# EasyEDA Pro project EVA_RT.eprj, schematic EVA_RT
Board Name: #3_EVA_RT; Create Date: 2025-01-23; Page Name: P1; Project Name: EVA_RT; Schematic Name: EVA_RT; Update Date: 2025-01-28; Company: EasyEDA.com; Drawed: EasyEDA Pro; Page Size: A4; Part Number: JLCPCB-002; Reviewed: EasyEDA Pro; Version: V0.1
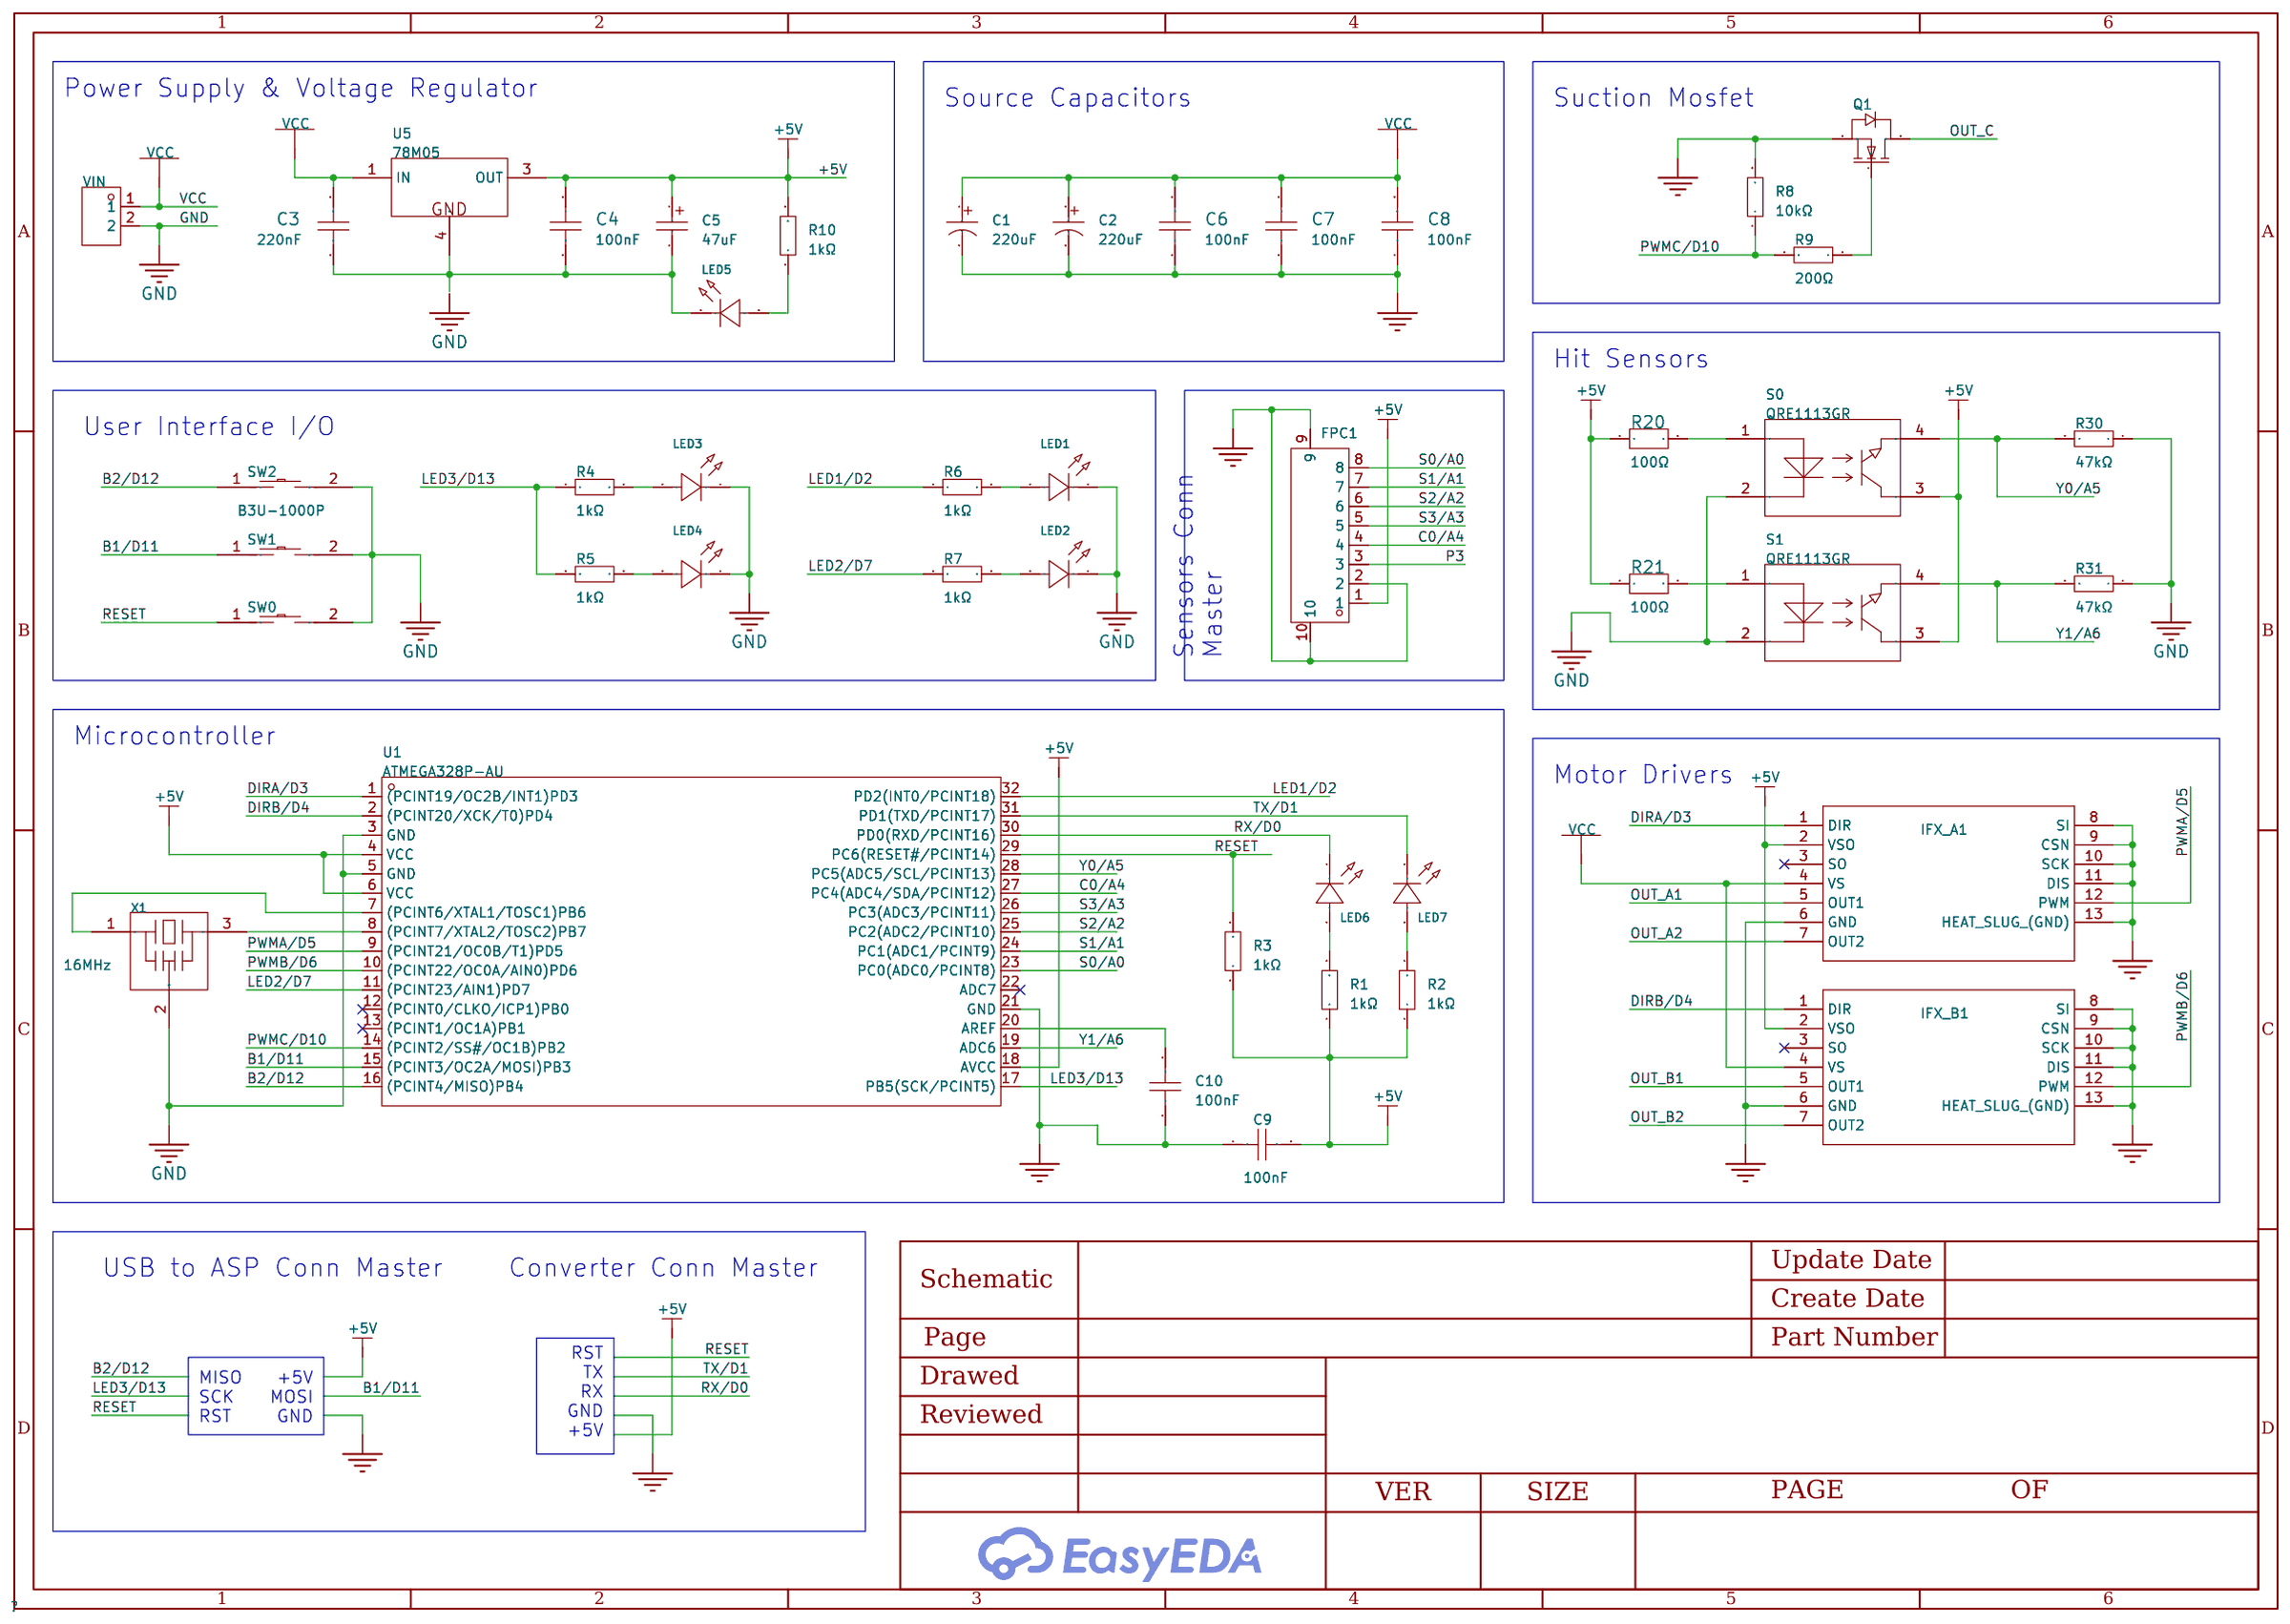
[diagram p2: schematic sheet]

## Parts
C1  220uF  [CAP-TH_BD6.3-P2.50-D1.0-FD]
C2  220uF  [CAP-TH_BD6.3-P2.50-D1.0-FD]
C3  220nF  [C0805]
C4  100nF  [C0805]
C5  47uF  [CAP-SMD_L3.2-W1.6-RD]
C6  100nF  [C0805]
C7  100nF  [C0805]
C8  100nF  [C0805]
C9  100nF  [C0603]
C10  100nF  [C0603]
FPC1  FFC05001-08SBA124W5M  [FFC-SMD_FFC05001-08SBA124W5M]
IFX_A1  -  [PG-DSO-12-17]
IFX_B1  -  [PG-DSO-12-17]
LED1  XL-1608SURC-06  [LED0603-RD_RED]
LED2  XL-1608SURC-06  [LED0603-RD_RED]
LED3  XL-1608SURC-06  [LED0603-RD_RED]
LED4  XL-1608SURC-06  [LED0603-RD_RED]
LED5  XL-1608SURC-06  [LED0603-RD_RED]
LED6  XL-1608SURC-06  [LED0603-RD_RED]
LED7  XL-1608SURC-06  [LED0603-RD_RED]
Q1  IRFR3411TR-VB  [TO-252-2_L6.6-W6.1-P4.57-LS9.9-BR-CW]
R1  1kΩ  [R0603]
R2  1kΩ  [R0603]
R3  1kΩ  [R0603]
R4  1kΩ  [R0603]
R5  1kΩ  [R0603]
R6  1kΩ  [R0603]
R7  1kΩ  [R0603]
R8  10kΩ  [R0603]
R9  200Ω  [R0603]
R10  1kΩ  [R0603]
R20  100Ω  [R0603]
R21  100Ω  [R0603]
R30  47kΩ  [R0603]
R31  47kΩ  [R0603]
S0  QRE1113GR  [OPTO-SMD_QRE1113GR]
S1  QRE1113GR  [OPTO-SMD_QRE1113GR]
SW0  B3U-1000P  [KEY-SMD_B3U-1000PM]
SW1  B3U-1000P  [KEY-SMD_B3U-1000PM]
SW2  B3U-1000P  [KEY-SMD_B3U-1000PM]
U1  ATMEGA328P-AU  [TQFP-32_L7.0-W7.0-P0.80-LS9.0-BL]
U5  78M05  [TO-252-2_L6.5-W6.1-P4.58-LS10.0-TL]
VIN  KH-2.54PH180-1X2P-L11.5  [HDR-TH_2P-P2.54-V-M]
X1  16MHz  [OSC-SMD_3P-L3.2-W1.3-P1.2-L]

## Library data of the parts
C1 C2 = KM221M025E110A: Capacitance: Tolerance:±20% Tolerance:±20% Rated Voltage: φD: L: Lead Spacing: Lifetime @ Temp:2000hrs@105℃; LCSC Part Name: 220uF ±20% 25V; Supplier Part: C59416; Manufacturer: CapXon(丰宾); Supplier Footprint: 插件,D6.3xL11mm; JLCPCB Part Class: Extended Part; Datasheet: https://atta.szlcsc.com/upload/public/pdf/source/20150922/1457707409206.pdf; Supplier: LCSC; Tolerance: ±20%; Lifetime @ Temp: 2000hrs@105℃
C3 C4 C6-C8 = 0805B104M250CT: Capacitance: Tolerance:±20% Tolerance:±20% Voltage Rated: Temperature Coefficient:; LCSC Part Name: 100nF ±20% 25V; Supplier Part: C163183; Manufacturer: Walsin(华新科); Supplier Footprint: 0805; JLCPCB Part Class: Extended Part; Datasheet: https://atta.szlcsc.com/upload/public/pdf/source/20190614/C388069_4B3EF5497F6DC8E8932D1232046A3033.pdf; Supplier: LCSC; Tolerance: ±20%
C5 = TC212A476K006Y: Capacitance: Tolerance:±10% Tolerance:±10% Rated Voltage: Equivalent Series Resistance(ESR):2.5Ω@100kHz Operating Temperature:-55℃~+125℃ Operating Temperature:-55℃~+125℃; LCSC Part Name: 47uF ±10% 6.3V; Supplier Part: C108525; Manufacturer: Sunlord(顺络); Supplier Footprint: CASE-A-3216; JLCPCB Part Class: Extended Part; Datasheet: https://atta.szlcsc.com/upload/public/pdf/source/20231030/DDA5D10C6B7FCAF98AC7C23C2BD0B0CB.pdf; Supplier: LCSC; Tolerance: ±10%; Equivalent Series Resistance(ESR): 2.5Ω@100kHz; Operating Temperature: -55℃~+125℃
C9 C10 = C1608NP01H101JT000N: Capacitance: Tolerance:±5% Tolerance:±5% Voltage Rated: Temperature Coefficient:; LCSC Part Name: 100pF ±5% 50V; Supplier Part: C343033; Manufacturer: TDK; Supplier Footprint: 0603; JLCPCB Part Class: Extended Part; Datasheet: https://atta.szlcsc.com/upload/public/pdf/source/20190311/C343033_2C1C068BC0A68B1F01ED28762004C2DC.pdf; Supplier: LCSC; Tolerance: ±5%
FPC1 = FFC05001-08SBA124W5M: Locking Feature:抽屉式 Contact Type:Contact,Top Number of Contacts:8P Pitch:0.5mm Mounting Type:卧贴 FFC, FCB Thickness:0.3mm FFC, FCB Thickness:0.3mm Height Above Board:2mm; LCSC Part Name: 间距:0.5mm P数:8P 抽屉式 上接; Supplier Part: C456419; Manufacturer: TXGA(特思嘉); Supplier Footprint: SMD,P=0.5mm,卧贴; JLCPCB Part Class: Extended Part; Datasheet: https://atta.szlcsc.com/upload/public/pdf/source/20191118/C456760_2EA6D213D04401C3F6010DA75CB9EC31.pdf; Supplier: LCSC; Locking Feature: 抽屉式; Contact Type: Contact,Top; Number of Contacts: 8P; Pitch: 0.5mm; Mounting Type: 卧贴; FFC, FCB Thickness: 0.3mm; Height Above Board: 2mm
IFX_A1 IFX_B1 = IFX9201SGAUMA1_
LED1-LED7 = XL-1608SURC-06: Emitted Color:Red Power Dissipation:55mW Forward Current:25mA Dominant Wavelength:617nm~621nm Dominant Wavelength:617nm~621nm Peak Wavelength:623nm Lens Color:无色透明透镜 Color Temperature:- Color Temperature:- Viewing Angle:120° Mounting Sytle:Positive post O; Supplier Part: C965799; Manufacturer: XINGLIGHT(成兴光); Supplier Footprint: 0603; JLCPCB Part Class: Extended Part; Datasheet: https://atta.szlcsc.com/upload/public/pdf/source/20221102/D860AFDD1CDB02C5A8064103A32707E2.pdf; Supplier: LCSC; Emitted Color: Red; Power Dissipation: 55mW; Forward Current: 25mA; Dominant Wavelength: 617nm~621nm; Peak Wavelength: 623nm; Lens Color: 无色透明透镜; Viewing Angle: 120°; Mounting Sytle: Positive post; Operating Temperature: -30℃~+85℃
Q1 = IRFR3411TR-VB: Type:1个NChannel Drain Source Voltage (Vdss): Continuous Drain Current (Id): Power Dissipation (Pd):- Drain Source On Resistance (RDS(on)@Vgs,Id):30mΩ@10V,40A Gate Threshold Voltage (Vgs(th)@Id):- Total Gate Charge (Qg@Vgs):- Input Capacitance (Ciss@Vds):-; LCSC Part Name: 1个N沟道 耐压:100V 电流:40A; Supplier Part: C879037; Manufacturer: VBsemi(微碧半导体); Supplier Footprint: TO-252-2; JLCPCB Part Class: Extended Part; Datasheet: https://atta.szlcsc.com/upload/public/pdf/source/20230505/CCB1EF06EBEE64800B0B9BD62D42A77A.pdf; Supplier: LCSC; Type: 1个NChannel; Drain Source On Resistance (RDS(on)@Vgs,Id): 30mΩ@10V,40A
R1-R7 R9 R10 = RC0603FR-071KL: Type:Thick Film Resistors Resistance: Tolerance:±1% Tolerance:±1% Power(Watts): Overload Voltage (Max): Temperature Coefficient:±100ppm/℃ Temperature Coefficient:±100ppm/℃ Operating Temperature Range:-55℃~+155℃ Operating Temperature Range:-55℃~+155℃; LCSC Part Name: 厚膜电阻 1kΩ ±1% 100mW; Supplier Part: C22548; Manufacturer: YAGEO(国巨); Supplier Footprint: 0603; JLCPCB Part Class: Extended Part; Datasheet: https://atta.szlcsc.com/upload/public/pdf/source/20180316/70C0E2BDAE7FCC62C531A5A58D202EE1.pdf; Supplier: LCSC; Type: Thick Film Resistors; Tolerance: ±1%; Temperature Coefficient: ±100ppm/℃; Operating Temperature Range: -55℃~+155℃
R8 = RC0603FR-071KL: Type:Thick Film Resistors Resistance: Tolerance:±1% Tolerance:±1% Power(Watts): Overload Voltage (Max): Temperature Coefficient:±100ppm/℃ Temperature Coefficient:±100ppm/℃ Operating Temperature Range:-55℃~+155℃ Operating Temperature Range:-55℃~+155℃; LCSC Part Name: 厚膜电阻 1kΩ ±1% 100mW; Supplier Part: C22548; Manufacturer: YAGEO(国巨); Supplier Footprint: 0603; JLCPCB Part Class: Extended Part; Datasheet: https://atta.szlcsc.com/upload/public/pdf/source/20180316/70C0E2BDAE7FCC62C531A5A58D202EE1.pdf; Supplier: LCSC; Type: Thick Film Resistors; Tolerance: ±1%; Temperature Coefficient: ±100ppm/℃; Operating Temperature Range: -55℃~+155℃; Check: false
R20 R21 = SCR0603J100R: Resistance: Tolerance:±5% Tolerance:±5%; LCSC Part Name: 100Ω ±5%; Supplier Part: C3017758; Manufacturer: VO(翔胜); Supplier Footprint: 0603; JLCPCB Part Class: Extended Part; Datasheet: https://atta.szlcsc.com/upload/public/pdf/source/20220513/247AF9639BA21CF93567DC289CCC6A22.pdf; Supplier: LCSC; Tolerance: ±5%
R30 R31 = AC0603FR-0747KL: Type:Thick Film Resistors Resistance: Tolerance:±1% Tolerance:±1% Power(Watts): Temperature Coefficient:±100ppm/℃ Temperature Coefficient:±100ppm/℃ Overload Voltage (Max): Operating Temperature Range:-55℃~+155℃ Operating Temperature Range:-55℃~+155℃; LCSC Part Name: 47kΩ ±1% 100mW; Supplier Part: C111134; Manufacturer: YAGEO(国巨); Supplier Footprint: 0603; JLCPCB Part Class: Extended Part; Datasheet: https://atta.szlcsc.com/upload/public/pdf/source/20171221/C111134_15138309997331195189.pdf; Supplier: LCSC; Type: Thick Film Resistors; Tolerance: ±1%; Temperature Coefficient: ±100ppm/℃; Operating Temperature Range: -55℃~+155℃
S0 S1 = QRE1113GR: Supplier Part: C232862; Manufacturer: onsemi(安森美); Supplier Footprint: SMD-4P; JLCPCB Part Class: Extended Part; Datasheet: https://atta.szlcsc.com/upload/public/pdf/source/20221020/4EA8EB874547A092CF9AAECC2DF94CC1.pdf; Supplier: LCSC
SW0-SW2 = B3U-1000P_C231329: Circuit:SPST Actuator Style:Round Button Operating Force:153gf Mounting Style:Brick nogging Switch Length:3mm Switch Width:2.5mm Switch Height:1.6mm Contact Current:50mA Voltage Rating (DC):12V With Lamp:- Pin Style:SMDSplicing Mechanical Life:- Operating; LCSC Part Name: 3*2.5*1.6mm 立贴 轻触开关; Supplier Part: C231329; Manufacturer: OMRON(欧姆龙); Supplier Footprint: SMD,2.5x3mm; JLCPCB Part Class: Extended Part; Supplier: LCSC; Circuit: SPST; Actuator Style: Round Button; Operating Force: 153gf; Mounting Style: Brick nogging; Switch Length: 3mm; Switch Width: 2.5mm; Switch Height: 1.6mm; Contact Current: 50mA; Voltage Rating (DC): 12V; Pin Style: SMDSplicing; Operating Temperature: -25℃~+70℃
U1 = ATMEGA328P-AU_C14877: Application Area:- CPU Core:AVR CPU Maximum Speed:20MHz Operating Voltage Range:1.8V~5.5V Operating Voltage Range:1.8V~5.5V Program Storage Size:32KB Program Memory Type:FLASH RAM Size:2KB EEPROM:1KB GPIO Ports Number:23 ADC (Bit):10bit DAC (Bit):- PWM (B; Supplier Part: C14877; Manufacturer: MICROCHIP(美国微芯); Supplier Footprint: TQFP-32(7x7); JLCPCB Part Class: Basic Part; Datasheet: https://atta.szlcsc.com/upload/public/pdf/source/20140621/1457707095197.pdf; Supplier: LCSC; CPU Core: AVR; CPU Maximum Speed: 20MHz; Operating Voltage Range: 1.8V~5.5V; Program Storage Size: 32KB; Program Memory Type: FLASH; RAM Size: 2KB; EEPROM: 1KB; GPIO Ports Number: 23; ADC (Bit): 10bit; Peripheral/Function: WDT；PWM；WDT；PWM; Watchdog: 有; Low-Voltage Detect: 有; Internal Oscillator: 有; Operating Temperature Range: -40℃~+85℃
U5 = 78M05_C111265: Output Type: Output Polarity:Positive Number of Outputs:1 Maximum Input Voltage:35V Output Voltage:5V~5V Output Voltage:5V~5V Dropout Voltage:2V@(500mA) Output Current:500mA Power Supply Rejection Ratio (PSRR):78dB@(120Hz); LCSC Part Name: 输入35V 输出5V 500mA; Supplier Part: C111265; Manufacturer: SHIKUES(时科); Supplier Footprint: TO-252-2(DPAK); JLCPCB Part Class: Extended Part; Datasheet: https://atta.szlcsc.com/upload/public/pdf/source/20170508/1494209360971.pdf; Supplier: LCSC; Output Polarity: Positive; Number of Outputs: 1; Maximum Input Voltage: 35V; Output Voltage: 5V~5V; Dropout Voltage: 2V@(500mA); Output Current: 500mA; Power Supply Rejection Ratio (PSRR): 78dB@(120Hz)
VIN = KH-2.54PH180-1X2P-L11.5: Pitch:2.54mm Number of Pins:2 Number of Rows:1 Pin Structure:1x2P Row Spacing:- Mounting Type:直插 Circluar Pins/Square Pins:方针 Current Rating (Max):3A Voltage Rating (Max):- Length of Mating Pin:6mm Insulation Height:2.5mm Length of End Connection Pin:3mm; LCSC Part Name: 2.54mm 1x2P 直插 方针; Supplier Part: C2905434; Manufacturer: kinghelm(金航标); Supplier Footprint: 直插,P=2.54mm; JLCPCB Part Class: Extended Part; Datasheet: https://atta.szlcsc.com/upload/public/pdf/source/20211019/75EAF9E0823F75B5BB441C07BAE9F5E6.pdf; Supplier: LCSC; Pitch: 2.54mm; Number of Pins: 2; Number of Rows: 1; Pin Structure: 1x2P; Mounting Type: 直插; Circluar Pins/Square Pins: 方针; Current Rating (Max): 3A; Length of Mating Pin: 6mm; Insulation Height: 2.5mm; Length of End Connection Pin: 3mm; Operating Temperature Range: -40~+105; Color: 黑色
X1 = CSTCE16M0V13C99-R0: Frequency: Built-in Load Capacitance: Resonant Impedance: Operating Temperature:-40℃~+125℃ Operating Temperature:-40℃~+125℃; LCSC Part Name: 16MHz ±0.1% 内置负载电容:15pF; Supplier Part: C118038; Manufacturer: muRata(村田); Supplier Footprint: SMD3213-3P; JLCPCB Part Class: Extended Part; Datasheet: https://atta.szlcsc.com/upload/public/pdf/source/20170712/C118038_1499832435920814632.pdf; Supplier: LCSC; Operating Temperature: -40℃~+125℃

## Nets
+5V: C4.2 C5.1 C9.2 FPC1.1 IFX_A1.2(VSO) IFX_B1.2(VSO) R1.1 R2.1 R3.1 R10.2 R20.1 R21.1 S0.3 S1.3 U1.4(VCC) U1.6(VCC) U1.18(AVCC) U5.3(OUT)
GND: C1.2 C2.2 C6.1 C7.1 C8.1 C9.1 C10.2 FPC1.2 FPC1.9 FPC1.10 IFX_A1.6(GND) IFX_A1.8(SI) IFX_A1.9(CSN) IFX_A1.10(SCK) IFX_A1.11(DIS) IFX_A1.13(HEAT_SLUG_(GND)) IFX_B1.6(GND) IFX_B1.8(SI) IFX_B1.9(CSN) IFX_B1.10(SCK) IFX_B1.11(DIS) IFX_B1.13(HEAT_SLUG_(GND)) LED1.1(K) LED2.1(K) LED3.1(K) LED4.1(K) Q1.3(S) R8.2 R30.1 R31.1 S0.2 S1.2 SW0.2 SW1.2 SW2.2 U1.3(GND) U1.5(GND) U1.21(GND) VIN.2 X1.2(VSS)
VCC: C1.1 C2.1 C3.2 C6.2 C7.2 C8.2 IFX_A1.4(VS) IFX_B1.4(VS) U5.1(IN) VIN.1
B1/D11: SW1.1 U1.15((PCINT3/OC2A/MOSI)PB3)
B2/D12: SW2.1 U1.16((PCINT4/MISO)PB4)
C0/A4: FPC1.4 U1.27(PC4(ADC4/SDA/PCINT12))
DIRA/D3: IFX_A1.1(DIR) U1.1((PCINT19/OC2B/INT1)PD3)
DIRB/D4: IFX_B1.1(DIR) U1.2((PCINT20/XCK/T0)PD4)
LED1/D2: R6.1 U1.32(PD2(INT0/PCINT18))
LED2/D7: R7.1 U1.11((PCINT23/AIN1)PD7)
LED3/D13: R4.1 R5.1 U1.17(PB5(SCK/PCINT5))
OUT_A1: IFX_A1.5(OUT1)
OUT_A2: IFX_A1.7(OUT2)
OUT_B1: IFX_B1.5(OUT1)
OUT_B2: IFX_B1.7(OUT2)
OUT_C: Q1.2(D)
P3: FPC1.3
PWMA/D5: IFX_A1.12(PWM) U1.9((PCINT21/OC0B/T1)PD5)
PWMB/D6: IFX_B1.12(PWM) U1.10((PCINT22/OC0A/AIN0)PD6)
PWMC/D10: R8.1 R9.2 U1.14((PCINT2/SS#/OC1B)PB2)
RESET: R3.2 SW0.1 U1.29(PC6(RESET#/PCINT14))
RX/D0: LED6.1(K) U1.30(PD0(RXD/PCINT16))
S0/A0: FPC1.8 U1.23(PC0(ADC0/PCINT8))
S1/A1: FPC1.7 U1.24(PC1(ADC1/PCINT9))
S2/A2: FPC1.6 U1.25(PC2(ADC2/PCINT10))
S3/A3: FPC1.5 U1.26(PC3(ADC3/PCINT11))
TX/D1: LED7.1(K) U1.31(PD1(TXD/PCINT17))
Y0/A5: R30.2 S0.4 U1.28(PC5(ADC5/SCL/PCINT13))
Y1/A6: R31.2 S1.4 U1.19(ADC6)
$C10_1: C10.1 U1.20(AREF)
$LED1_2: LED1.2(A) R6.2
$LED2_2: LED2.2(A) R7.2
$LED3_2: LED3.2(A) R4.2
$LED4_2: LED4.2(A) R5.2
$LED5_2: LED5.2(A) R10.1
$LED6_2: LED6.2(A) R1.2
$LED7_2: LED7.2(A) R2.2
$Q1_1: Q1.1(G) R9.1
$R20_2: R20.2 S0.1
$R21_2: R21.2 S1.1
$U1_7: U1.7((PCINT6/XTAL1/TOSC1)PB6) X1.1
$U1_8: U1.8((PCINT7/XTAL2/TOSC2)PB7) X1.3
Net-(C3-1): C3.1 C4.1 C5.2 LED5.1(K) U5.4(GND)

Not connected (* = marked no-connect by the designer): IFX_A1 3(SO)*; IFX_B1 3(SO)*; U1 12((PCINT0/CLKO/ICP1)PB0)* 13((PCINT1/OC1A)PB1)* 22(ADC7)*

## Notes on the sheet
- Power Supply & Voltage Regulator
- Source Capacitors
- Suction Mosfet
- Hit Sensors
- User Interface I/O
- Sensors Conn
  Master
- Microcontroller
- Motor Drivers
- USB to ASP Conn Master
- Converter Conn Master
- RST
- TX
- MISO
- +5V
- RX
- SCK
- MOSI
- GND
- RST
- GND
- +5V
